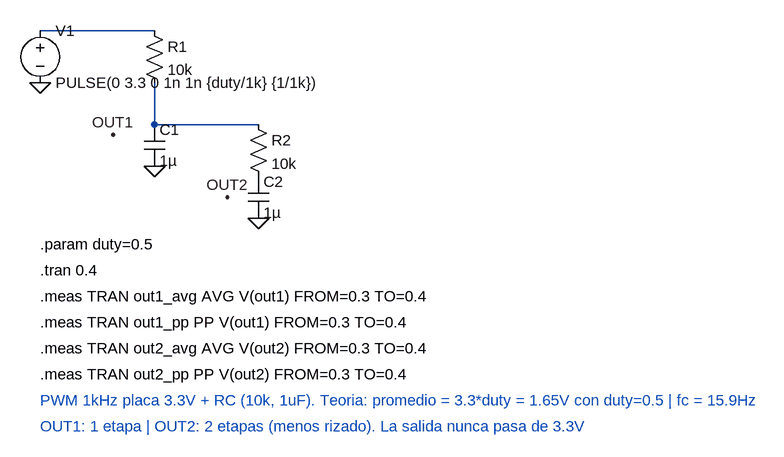
[diagram p0: schematic dac_pwm_rc.asc]
dac_pwm_rc.asc, the LTspice schematic file:
Version 4.1
SHEET 1 1216 680
WIRE 176 16 0 16
WIRE 176 160 176 96
WIRE 336 160 176 160
FLAG 0 96 0
FLAG 112 176 OUT1
FLAG 176 224 0
FLAG 288 272 OUT2
FLAG 336 304 0
SYMBOL voltage 0 0 R0
SYMATTR InstName V1
SYMATTR Value PULSE(0 3.3 0 1n 1n {duty/1k} {1/1k})
SYMBOL res 160 0 R0
SYMATTR InstName R1
SYMATTR Value 10k
SYMBOL cap 160 160 R0
SYMATTR InstName C1
SYMATTR Value 1µ
SYMBOL res 320 144 R0
SYMATTR InstName R2
SYMATTR Value 10k
SYMBOL cap 320 240 R0
SYMATTR InstName C2
SYMATTR Value 1µ
TEXT 0 344 Left 2 !.param duty=0.5
TEXT 0 384 Left 2 !.tran 0.4
TEXT 0 424 Left 2 !.meas TRAN out1_avg AVG V(out1) FROM=0.3 TO=0.4
TEXT 0 464 Left 2 !.meas TRAN out1_pp PP V(out1) FROM=0.3 TO=0.4
TEXT 0 504 Left 2 !.meas TRAN out2_avg AVG V(out2) FROM=0.3 TO=0.4
TEXT 0 544 Left 2 !.meas TRAN out2_pp PP V(out2) FROM=0.3 TO=0.4
TEXT 0 584 Left 2 ;PWM 1kHz placa 3.3V + RC (10k, 1uF). Teoria: promedio = 3.3*duty = 1.65V con duty=0.5 | fc = 15.9Hz
TEXT 0 624 Left 2 ;OUT1: 1 etapa | OUT2: 2 etapas (menos rizado). La salida nunca pasa de 3.3V

The netlist it stands for:
* dac_pwm_rc.asc
V1 N001 0 PULSE(0 3.3 0 1n 1n {duty/1k} {1/1k})
R1 N001 N002 10k
C1 N002 0 1µ
R2 N002 P001 10k
C2 P001 0 1µ
.param duty=0.5
.tran 0.4
.meas TRAN out1_avg AVG V(out1) FROM=0.3 TO=0.4
.meas TRAN out1_pp PP V(out1) FROM=0.3 TO=0.4
.meas TRAN out2_avg AVG V(out2) FROM=0.3 TO=0.4
.meas TRAN out2_pp PP V(out2) FROM=0.3 TO=0.4
* PWM 1kHz placa 3.3V + RC (10k, 1uF). Teoria: promedio = 3.3*duty = 1.65V con duty=0.5 | fc = 15.9Hz
* OUT1: 1 etapa | OUT2: 2 etapas (menos rizado). La salida nunca pasa de 3.3V
.backanno
.end